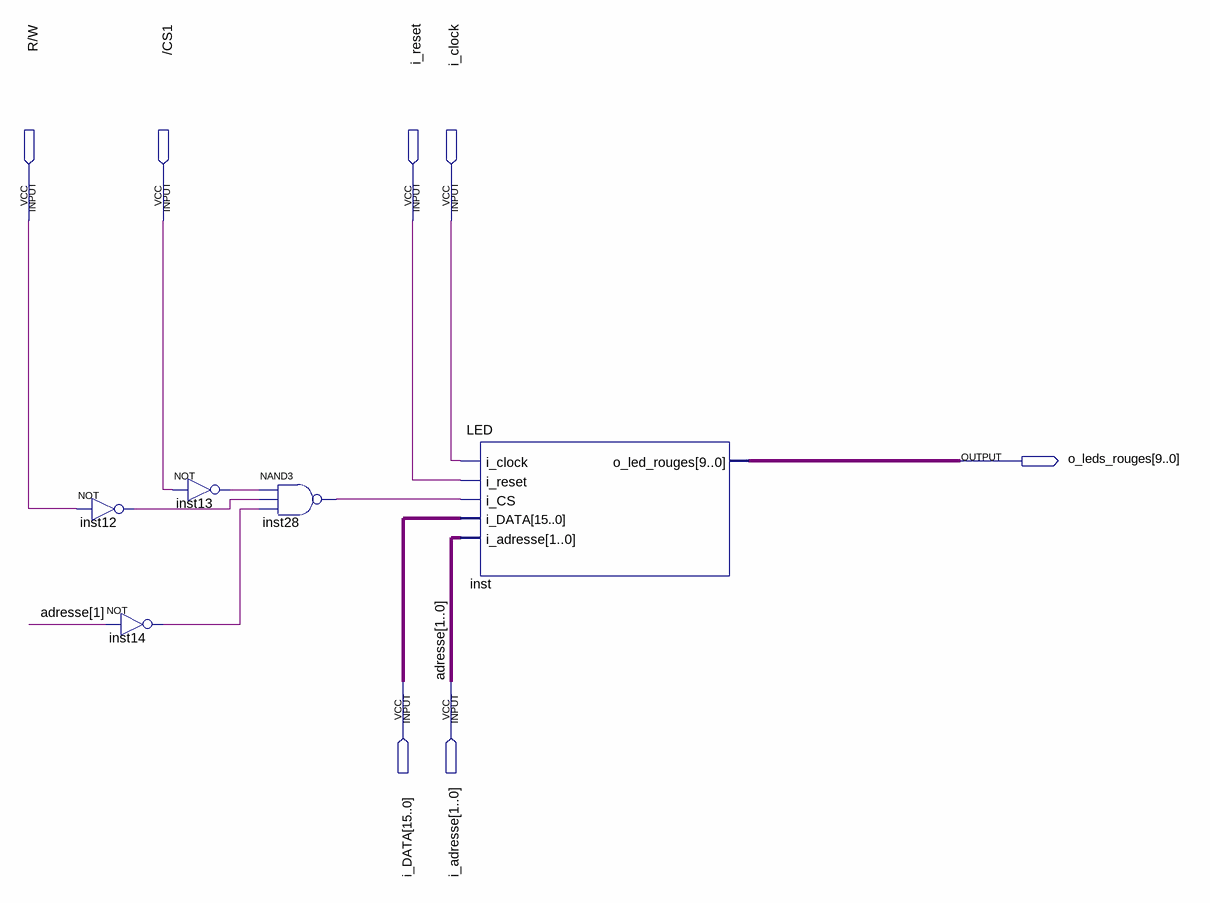
[diagram p0: schematic sheet]
// Quartus schematic LED_ROBOT.bdf as structural Verilog: 5 symbols, 7 pins
module LED_ROBOT (
  input  \R/W ,
  input  \/CS1 ,
  input  i_reset,
  input  i_clock,
  input  [15:0] i_DATA,
  input  [1:0] i_adresse,
  output [9:0] o_leds_rouges
);

  wire inst12_out, inst13_out, inst14_out, inst28_out;

  not inst12 (inst12_out, \R/W );
  not inst14 (inst14_out, i_adresse[1]);
  not inst13 (inst13_out, \/CS1 );
  nand inst28 (inst28_out, inst13_out, inst12_out, inst14_out);
  LED inst (
    .i_clock(i_clock), .i_reset(i_reset), .i_CS(inst28_out), .i_DATA(i_DATA), .i_adresse(i_adresse),
    .o_led_rouges(o_leds_rouges));

  // Other names for the same wires on the sheet: adresse[1:0] = i_adresse
endmodule
